# Altium project Debug Probe Adaptor.PrjPcb
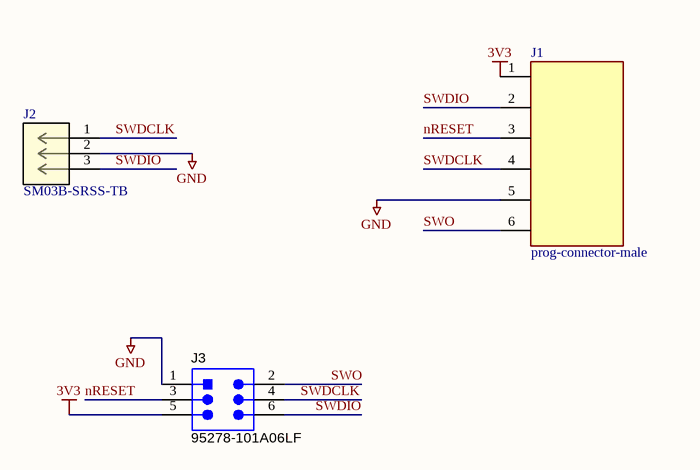
[diagram p0: Root.SchDoc]
ProjectTitle: Debug Probe Adaptor
1 sheet, 3 parts. Net scope: global (net labels, ports and power ports of the same name join across sheets).
Board file: Debug Probe Adaptor.PcbDoc

## Sheet Root.SchDoc: Debug Probe Adaptor Root
size Tabloid; Author: Adam Turaj; SheetNumber: 1; SheetTotal: 1

### Parts
J1  prog-connector-male  [Copy of prog-connector-Footprint-1]
J2  SM03B-SRSS-TB  [CONN_SM03B-SRSS-TB_JST]
J3  95278-101A06LF  [AMPM-95278-101A06LF_V]

### Nets
3V3: J1.1 J3.5
GND: J1.5 J2.2 J3.1
nRESET: J1.3 J3.3
SWDCLK: J1.4 J2.1 J3.4
SWDIO: J1.2 J2.3 J3.6
SWO: J1.6 J3.2

### Notes on the sheet
- Title:
- Author:
- Size:
- Date:
- Git Hash:
- Tabloid
- Prj:
- Variant:
- Edited:
- File:

### Library data of the parts
J1 = CMP-002-00078-1: Custom TC2030-NL based connector for programming
J2 = CMP-408-000000-1: No Description Available; Manufacturer_Name: JST; Design Item ID: SM03B-SRSS-TB; Type: Type; RefDes: RefDes; Manufacturer_Part_Number: SM03B-SRSS-TB; Copyright: Copyright (C) 2026 Ultra Librarian. All rights reserved.; Source: SM03B-SRSS-TB.SchLib
J3 = CMP-002-00024-2: Male Header, Pitch 2.54 mm, 2 x 3 Position, Height 14.4 mm, RoHS, Tape and Reel; Manufacturer: Amphenol; Package Reference: 95278-101A06LF; Package Description: Male Header, Pitch 2.54 mm, 2 x 3 Position, Height 14.4 mm; RoHS Compliant: Unknown; Case/Package: 95278-101A06LF; Connector Type: Header; Mounting Technology: SM; Gender: Male; Datasheet URL: http://portal.fciconnect.com/Comergent//fci/drawing/95278.pdf; Datasheet Version: Rev. AC, 03/2016